# Altium schematic sheet analog.SchDoc
size A4
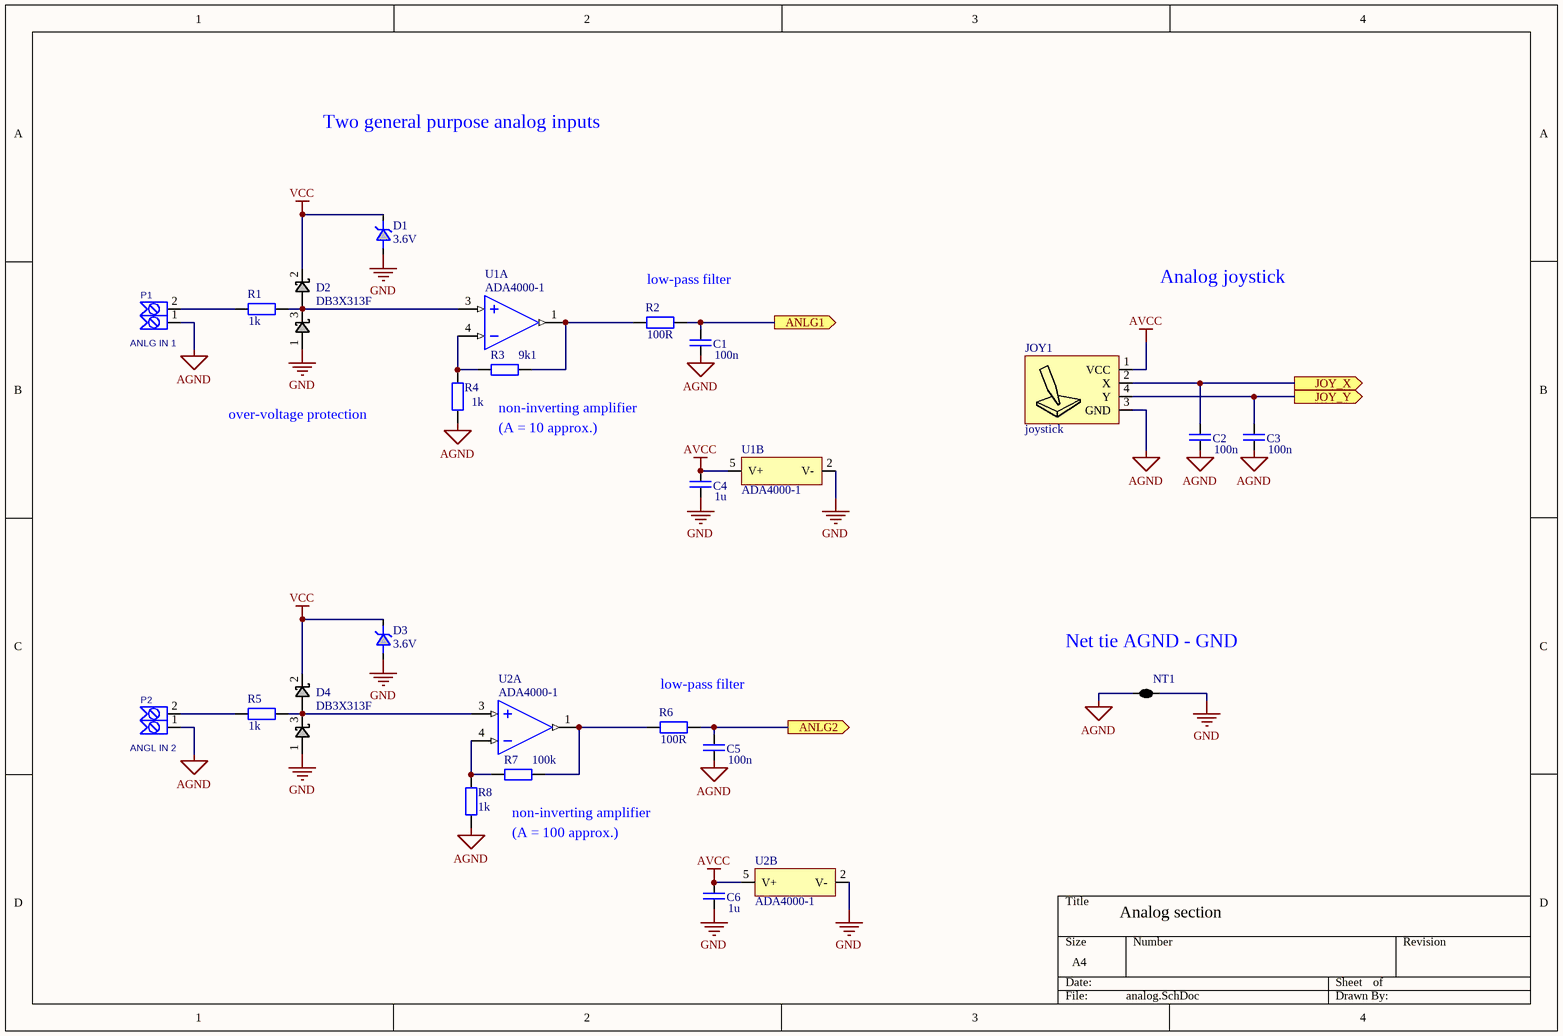
[diagram p0: analog.SchDoc]

## Parts
C1  value 100n  [C_0805]  (hidden comment: comment)
C2  value 100n  [C_0805]  (hidden comment: comment)
C3  value 100n  [C_0805]  (hidden comment: comment)
C4  value 1u  [C_0805]  (hidden comment: comment)
C5  value 100n  [C_0805]  (hidden comment: comment)
C6  value 1u  [C_0805]  (hidden comment: comment)
D1  3.6V  [SOD-123_N]
D2  DB3X313F  [SOT23-3]
D3  3.6V  [SOD-123_N]
D4  DB3X313F  [SOT23-3]
JOY1  joystick  [PSP1000JOY]
NT1  net tie 2-way  [NET TIE 2-way]  (value not drawn)  (net tie, no BOM)
P1  ANLG IN 1  [VRSTNA SPONKA 2P/16A]
P2  ANGL IN 2  [VRSTNA SPONKA 2P/16A]
R1  value 1k  [R_0805]  (hidden comment: comment)
R2  value 100R  [R_0805]  (hidden comment: comment)
R3  value 9k1  [R_0805]  (hidden comment: comment)
R4  value 1k  [R_0805]  (hidden comment: comment)
R5  value 1k  [R_0805]  (hidden comment: comment)
R6  value 100R  [R_0805]  (hidden comment: comment)
R7  value 100k  [R_0805]  (hidden comment: comment)
R8  value 1k  [R_0805]  (hidden comment: comment)
U1  ADA4000-1  [SOT23-5]  (parts A,B of 2)
U2  ADA4000-1  [SOT23-5]  (parts A,B of 2)

## Ports
ANLG1 (out), ANLG2 (out), JOY_X (out), JOY_Y (out)

## Nets
AGND: C1.2 C2.2 C3.2 C5.2 JOY1.3(GND) NT1.1 P1.1 P2.1 R4.1 R8.1
AVCC: C4.1 C6.1 JOY1.1(VCC) U1.5(V+) U2.5(V+)
GND: C4.2 C6.2 D1.A D2.1(A) D3.A D4.1(A) NT1.2 U1.2(V-) U2.2(V-)
VCC: D1.C D2.2(C) D3.C D4.2(C)
ANLG1: C1.1 R2.2 ; port ANLG1
ANLG2: C5.1 R6.2 ; port ANLG2
JOY_X: C2.1 JOY1.2(X) ; port JOY_X
JOY_Y: C3.1 JOY1.4(Y) ; port JOY_Y
NetD2_3: D2.3(AC) R1.2 U1.3(IN+)
NetD4_3: D4.3(AC) R5.2 U2.3(IN+)
NetP1_2: P1.2 R1.1
NetP2_2: P2.2 R5.1
NetR2_1: R2.1 R3.2 U1.1(OUT)
NetR3_1: R3.1 R4.2 U1.4(IN-)
NetR6_1: R6.1 R7.2 U2.1(OUT)
NetR7_1: R7.1 R8.2 U2.4(IN-)

## Notes on the sheet
- Two general purpose analog inputs
- low-pass filter
- Analog joystick
- over-voltage protection
- non-inverting amplifier
- (A = 10 approx.)
- (near NT1) Net tie AGND - GND
- (A = 100 approx.)
- Analog section

## Library data of the parts
C1-C6 = Capacitor: Generic capacitor
D1 D3 = MMSZ5227B: Zener Single Diode, 3.6 V, 500 mW, SOD-123, 5 %, 2 Pins, 150 °C; HelpURL: https://www.farnell.com/datasheets/1670964.pdf; Manufacturer part number: MMSZ5227B
D2 D4 = DB3X313F: Schottky Rectifier, 30 V, 130 mA, Dual Series, SOT-23, 3 Pins, 550 mV; HelpURL: https://www.farnell.com/datasheets/1912091.pdf; Manufacturer part number: DB3X313F
JOY1 = joystick: Analog joystick
P1 P2 = Screw terminal 2P 200mil: Generic screw terminal, 2 poles, 200 mil pitch; Value: *
R1-R8 = Resistor: Generic resistor
U1 U2 = ADA4000-1: Operational Amplifier, Single, 1 Amplifier, 5 MHz, 20 V/µs, ± 4V to ± 18V, TSOT, 5 Pins; Part Number: XOG0003; Manufacturer: Analog devices; Manufacturer Number: ADA4000-1AUJZ-R7; Dealer number: 2461002; Dealer: Farnell; Supply voltage max: +-18V; Devices: 1; Category: Integrated circuits; Price: 1.97; Case: SOT; Technology: SMT; HelpURL: https://www.farnell.com/datasheets/698265.pdf